# EasyEDA Pro project entrada_erick_v7_2026-11-13.epro

# Schematic Schematic1
Board Name: Board1; Create Date: 2026-11-04; Page Name: P1; Project Name: RUSH - corrigido; Schematic Name: Schematic1; Update Date: 2026-11-06; Company: EasyEDA.com; Drawn: Erick; Page Size: A4; Version: V1.0
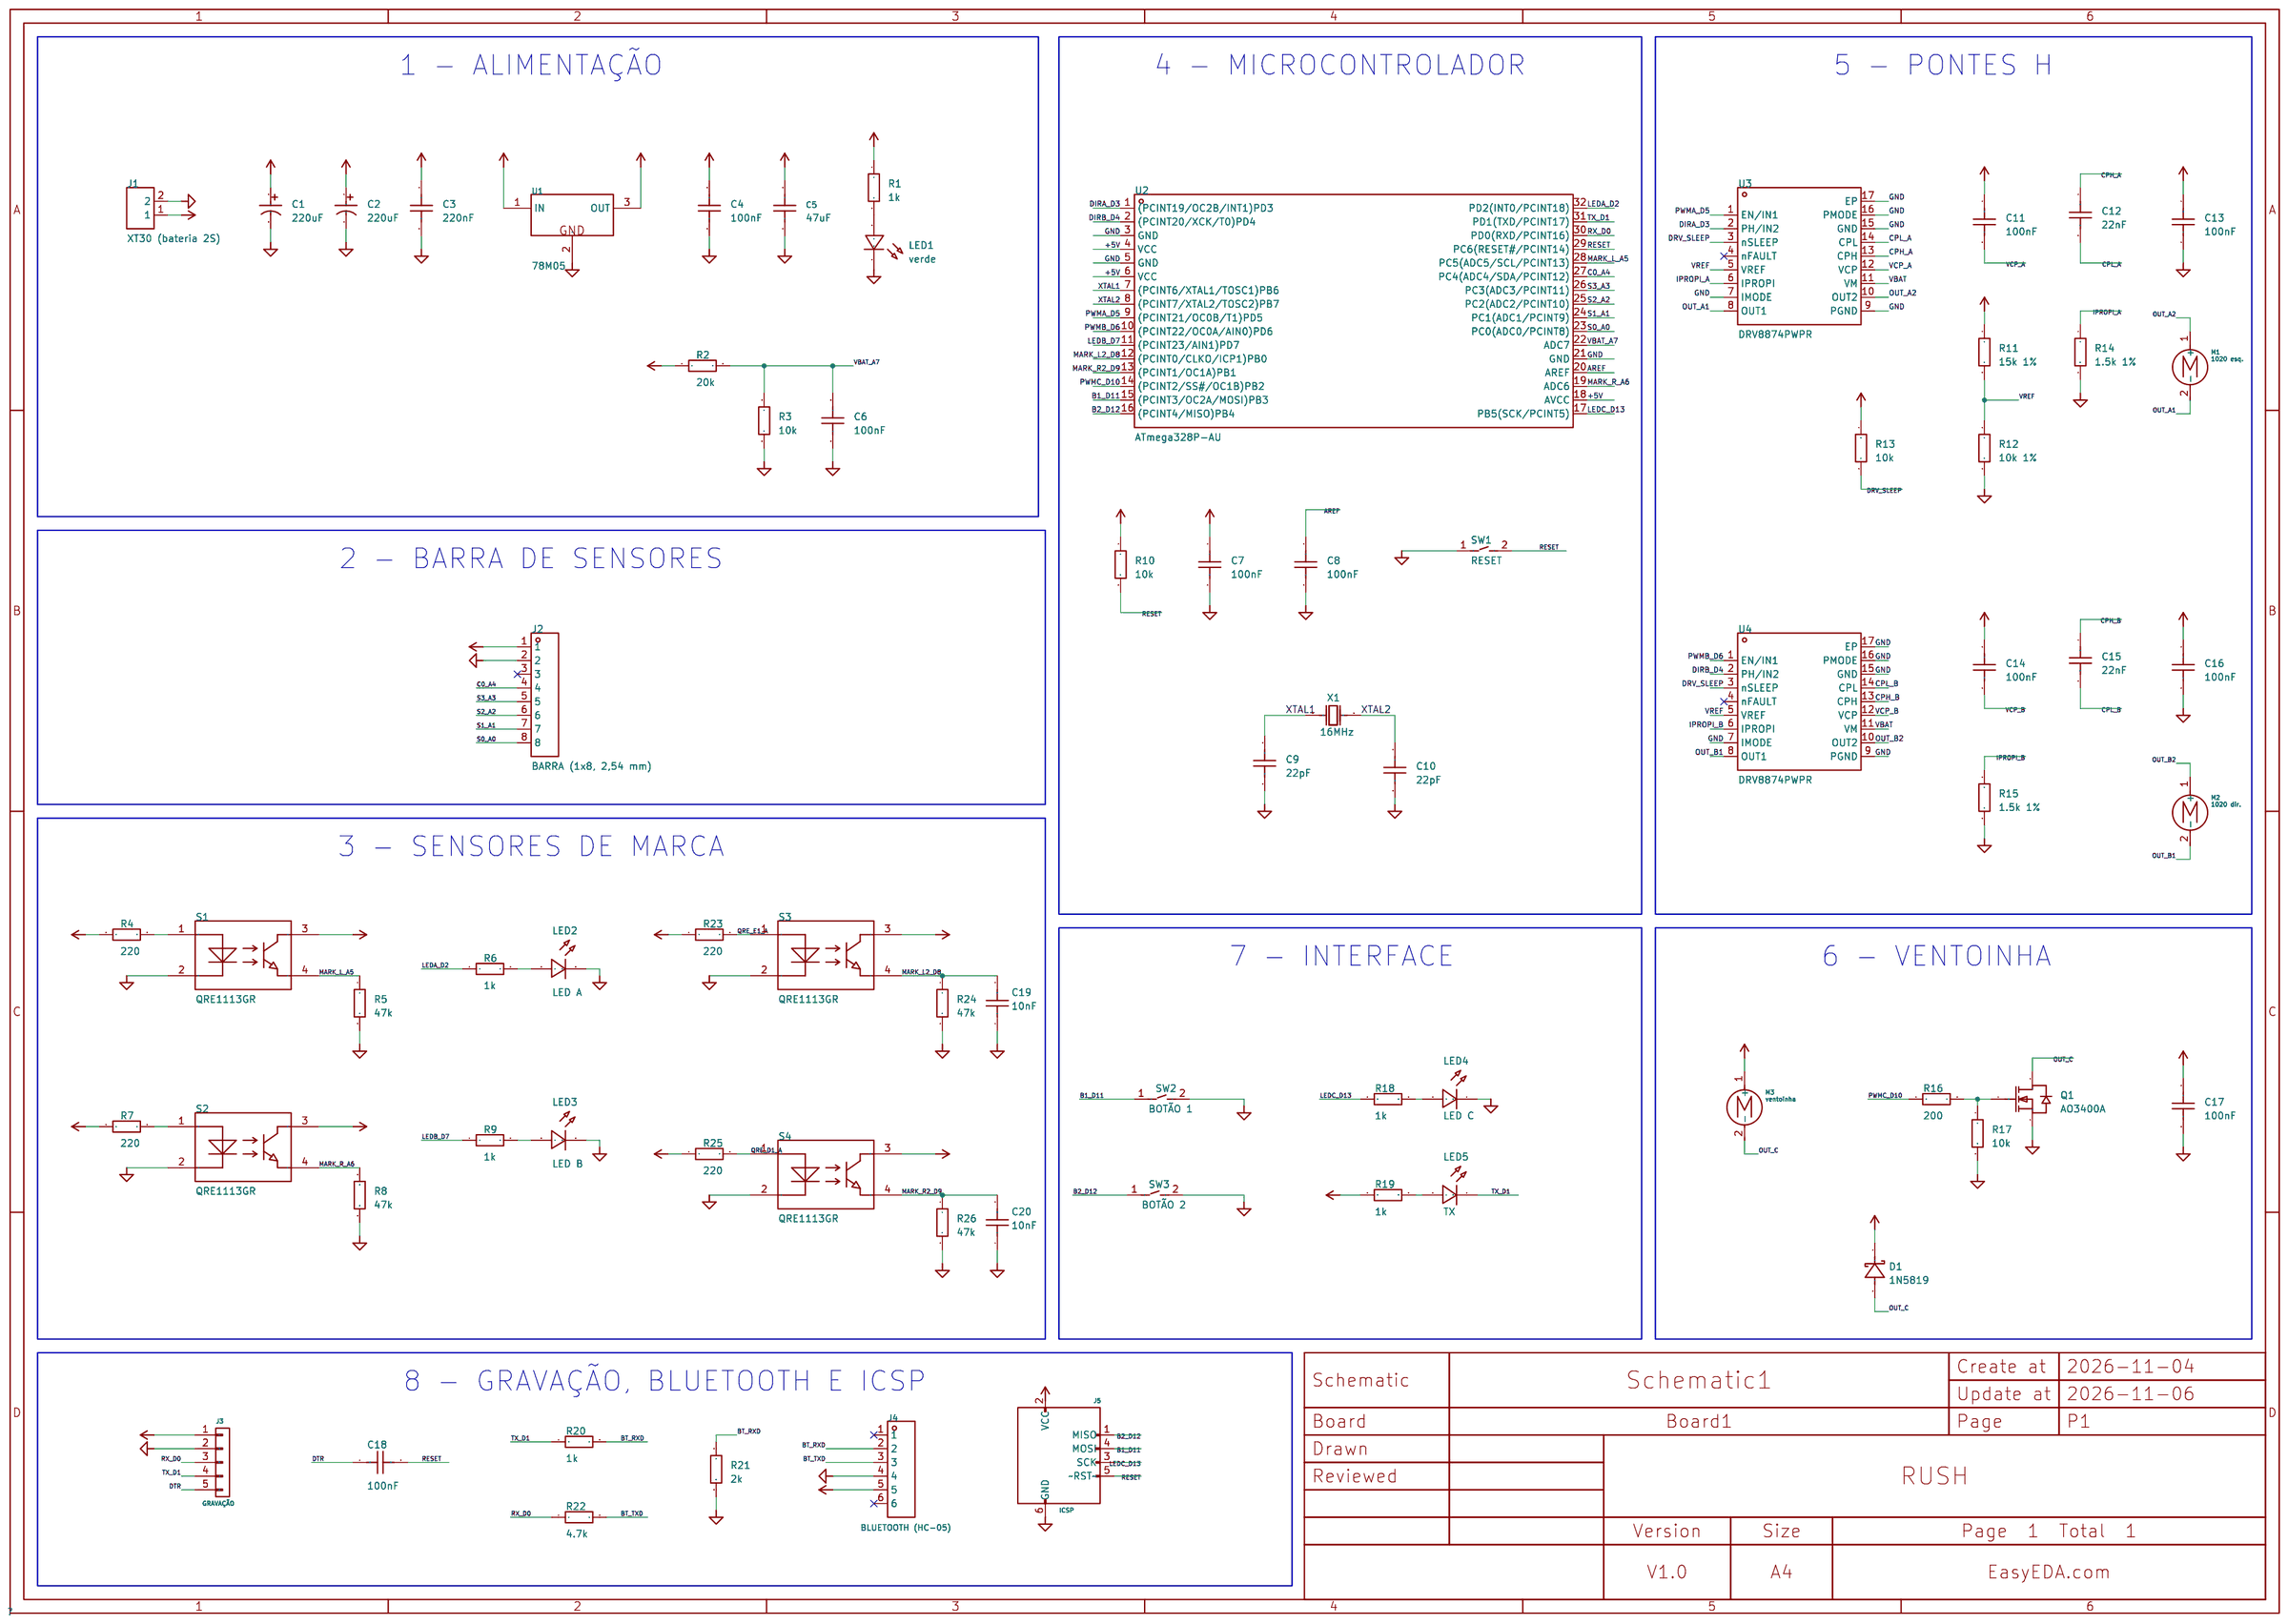
[diagram p0: schematic sheet]

## Parts
C1  220uF  [CAP-TH_BD6.3-P2.50-D1.0-FD]
C2  220uF  [CAP-TH_BD6.3-P2.50-D1.0-FD]
C3  220nF  [C0603]
C4  100nF  [C0603]
C5  47uF  [C1210]
C6  100nF  [C0603]
C7  100nF  [C0603]
C8  100nF  [C0603]
C9  22pF  [C0603]
C10  22pF  [C0603]
C11  100nF  [C0603]
C12  22nF  [C0603]
C13  100nF  [C0603]
C14  100nF  [C0603]
C15  22nF  [C0603]
C16  100nF  [C0603]
C17  100nF  [C0603]
C18  100nF  [C0603]
C19  10nF  [C0603]
C20  10nF  [C0603]
D1  1N5819  [SOD-123_L2.7-W1.6-LS3.7-RD-1]
J1  XT30 (bateria 2S)  [CONN-TH_XT30U-M]
J2  BARRA (1x8, 2,54 mm)  [HDR-TH_8P-P2.54-V-M]
J3  GRAVAÇÃO  [seguidor_alpha:HDR_1x05_P2.54_SMD_DEITADA]
J4  BLUETOOTH (femea 1x6, ordem HC-05)  [HDR-TH_6P-P2.54-V-F]
J5  ICSP  [seguidor_alpha:ICSP_6P_SMD_BOT]
LED1  verde  [LED0603-RD_GREEN]
LED2  LED A  [LED0603-RD_GREEN]
LED3  LED B  [LED0603-RD_GREEN]
LED4  LED C  [LED0603-RD_GREEN]
LED5  TX  [LED0603-RD_GREEN]
M1  1020 esq.  [seguidor_alpha:MOTOR_1020_2P]
M2  1020 dir.  [seguidor_alpha:MOTOR_1020_2P]
M3  ventoinha  [seguidor_alpha:MOTOR_1020_2P]
Q1  AO3400A  [SOT-23-3_L2.9-W1.3-P1.90-LS2.4-BR]
R1  1k  [R0603]
R2  20k 1%  [R0603]
R3  10k 1%  [R0603]
R4  220  [R0603]
R5  47k  [R0603]
R6  1k  [R0603]
R7  220  [R0603]
R8  47k  [R0603]
R9  1k  [R0603]
R10  10k  [R0603]
R11  15k 1%  [R0603]
R12  10k 1%  [R0603]
R13  10k  [R0603]
R14  1.5k 1%  [R0603]
R15  1.5k 1%  [R0603]
R16  200  [R0603]
R17  10k  [R0603]
R18  1k  [R0603]
R19  1k  [R0603]
R20  1k  [R0603]
R21  2k  [R0603]
R22  4.7k  [R0603]
R23  220  [R0603]
R24  47k  [R0603]
R25  220  [R0603]
R26  47k  [R0603]
S1  QRE1113GR  [OPTO-SMD_QRE1113GR]
S2  QRE1113GR  [OPTO-SMD_QRE1113GR]
S3  QRE1113GR  [OPTO-SMD_QRE1113GR]
S4  QRE1113GR  [OPTO-SMD_QRE1113GR]
SW1  RESET  [KEY-SMD_L6.1-W3.7-LS8.0-2]
SW2  BOTÃO 1  [KEY-SMD_L6.1-W3.7-LS8.0-2]
SW3  BOTÃO 2  [KEY-SMD_L6.1-W3.7-LS8.0-2]
U1  78M05  [TO-252-2_L6.5-W6.1-P4.58-LS10.0-TL]
U2  ATmega328P-AU  [TQFP-32_L7.0-W7.0-P0.80-LS9.0-BL]
U3  DRV8874PWPR  [HTSSOP-16_L5.0-W4.4-P0.65-LS6.4-BL-EP]
U4  DRV8874PWPR  [HTSSOP-16_L5.0-W4.4-P0.65-LS6.4-BL-EP]
X1  16MHz  [CRYSTAL-SMD_L5.0-W3.2]

## Library data of the parts
C1 C2 = KM221M025E110A: entre os pes da carcaca, como no EVA-RT; LCSC Part Name: 220uF ±20% 25V; Supplier Part: C59416; Manufacturer: CapXon(丰宾); Supplier Footprint: 插件,D6.3xL11mm; JLCPCB Part Class: Extended Part; Datasheet: https://item.szlcsc.com/datasheet/KM221M025E110A/60469.html; Supplier: LCSC; Tolerance: ±20%; Voltage Rating: 25V; Ripple Current: 235mA@120Hz; Pin Spacing: 2.5mm; Diameter: 6.3mm; Height - Seated (Max): 11mm; Lifetime: 2000hrs@105℃; Operating Temperature: -40℃~+105℃; Polarity type: Polarized; Encapsulamento: eletrolitico 25 V, radial D6,3 mm P2,5; DNP: no
C3 = CAP_0603: Supplier Footprint: 0603; Encapsulamento: 0603 50 V; DNP: no; Voltage Rating: 50V
C4 C9 C10 = CAP_0603: Supplier Footprint: 0603; Encapsulamento: 0603; DNP: no; Voltage Rating: 16V
C5 = GRM32ER61A476KE20L: Capacitance:47uF Tolerance:±10% Tolerance:±10% Voltage Rating:10V Temperature Coefficient:X5R; LCSC Part Name: 47uF ±10% 10V; Supplier Part: C397312; Manufacturer: muRata(村田); Supplier Footprint: 1210; JLCPCB Part Class: Extended Part; Datasheet: https://item.szlcsc.com/datasheet/GRM32ER61A476KE20L/378872.html; Supplier: LCSC; Tolerance: ±10%; Voltage Rating: 10V; Temperature Coefficient: X5R
C6 = CAP_0603: filtro da medicao (opcional); Supplier Footprint: 0603; Encapsulamento: 0603; DNP: no; Voltage Rating: 16V
C7 = CAP_0603: junto aos pinos VCC; Supplier Footprint: 0603; Encapsulamento: 0603; DNP: no; Voltage Rating: 16V
C8 = CAP_0603: AREF (referencia = AVCC no firmware); Supplier Footprint: 0603; Encapsulamento: 0603; DNP: no; Voltage Rating: 16V
C11 C14 = CAP_0603: VCP -> VM; Supplier Footprint: 0603; Encapsulamento: 0603 16 V X7R; DNP: no; Voltage Rating: 16V
C12 C15 = CAP_0603: CPH -> CPL (tensao >= VM); Supplier Footprint: 0603; Encapsulamento: 0603 50 V X7R; DNP: no; Voltage Rating: 50V
C13 C16 = CAP_0603: VM, junto ao pino 11; Supplier Footprint: 0603; Encapsulamento: 0603 25 V X7R; DNP: no; Voltage Rating: 25V
C17 = CAP_0603: Supplier Footprint: 0603; Encapsulamento: 0603 25 V; DNP: no; Voltage Rating: 25V
C18 = CAP_0603: reset automatico pelo DTR; Supplier Footprint: 0603; Encapsulamento: 0603; DNP: no; Voltage Rating: 16V
C19 = CAP_0603: filtro RC com o 47k (trilha longa ate o pino 12); ver PINOS.md; Supplier Footprint: 0603; Encapsulamento: 0603; DNP: no; Voltage Rating: 50V
C20 = CAP_0603: DNP: montar so para leitura por tempo de descarga (ver PINOS.md); Supplier Footprint: 0603; Encapsulamento: 0603; DNP: yes; Voltage Rating: 50V
D1 = 1N5819HW: diodo de roda livre (novo; o EVA-RT nao tem); LCSC Part Name: 电压:40V 电流:1A; Supplier Part: C2905649; Manufacturer: TECH PUBLIC(台舟); Supplier Footprint: SOD-123; JLCPCB Part Class: Extended Part; Datasheet: https://item.szlcsc.com/datasheet/1N5819HW/3175946.html; Supplier: LCSC; Voltage - Forward(Vf@If): 900mV@3A; Voltage - DC Reverse(Vr): 40V; Current - Rectified: 1A; Reverse Leakage Current (Ir): 1mA@40V; Non-Repetitive Peak Forward Surge Current: 9A; Encapsulamento: SOD-123 (B5819W) ou 1N5819 nos terminais do motor; DNP: no
J1 = XT30U-M.G.B: pino 1 = +, pino 2 = -; LCSC Part Name: AMASS(艾迈斯)模插头锂电池插头电机控制器充电器电池接头连接器焊接 2芯锂电插头 黑色 公头15AXT30U-M.G.B; Supplier Part: C19268020; Manufacturer: AMASS(艾迈斯); JLCPCB Part Class: Extended Part; Datasheet: https://item.szlcsc.com/datasheet/XT30U-M.G.B/20526031.html; Supplier: LCSC; Encapsulamento: XT30PW-M de placa ou rabicho XT30; DNP: no
J2 = 2.54-1*8: Pin Structure:1x8P Pitch:2.54mm Circluar Pins/Square Pins:Pin Header Mounting Type:Through Hole Number of Rows:1 Number of Pins:8P Current Rating:2.5A Length of Mating Pin:6mm Insulation Height:2.54mm Length of End Connection Pin:3mm Contact Material:Bras; LCSC Part Name: 1x8P 间距:2.54mm 方针 直插; Supplier Part: C5156616; Manufacturer: ZHOURI(洲日); Supplier Footprint: 插件,P=2.54mm; JLCPCB Part Class: Extended Part; Datasheet: https://item.szlcsc.com/datasheet/2.54-1*8/5790716.html; Supplier: LCSC; Pin Structure: 1x8P; Pitch: 2.54mm; Circluar Pins/Square Pins: Pin Header; Mounting Type: Through Hole; Number of Rows: 1; Number of Pins: 8P; Current Rating: 2.5A; Length of Mating Pin: 6mm; Insulation Height: 2.54mm; Length of End Connection Pin: 3mm; Contact Material: Brass; Contact Plating: Gold; Operating Temperature: -40℃~+105℃; Encapsulamento: barra de pinos 1x8 2,54 mm; DNP: no
J3 = Connector_Generic_Conn_01x05: 1=+5V, 2=GND, 3=RX_D0, 4=TX_D1, 5=DTR. Face inferior no layout.; Encapsulamento: 5 pads SMD, passo 2,54 mm; montagem na face inferior; DNP: no
J4 = 2.54-1*6P母: frente direita, x = 32,5; HC-06 nas vias 2-5 (virado); LCSC Part Name: 1x6P 间距:2.54mm 直插; Supplier Part: C40877; Manufacturer: BOOMELE(博穆精密); Supplier Footprint: 插件,P=2.54mm; JLCPCB Part Class: Extended Part; Datasheet: https://item.szlcsc.com/datasheet/2.54-1*6P%25E6%25AF%258D/41861.html; Supplier: LCSC; Holes Structure: 1x6P; Pitch: 2.54mm; Circular Hole / Square Hole: Square Hole; Mounting Type: Through Hole; Number of Rows: 1; Number of Positions: 6P; Current Rating: 3A; Holes Direction: Top; Insulation Height: 8.5mm; Contact Material: Brass; Contact Plating: Gold; Operating Temperature: -40℃~+105℃; PIN Length: 3.2mm; Encapsulamento: barra femea 1x6 2,54 mm; DNP: no
J5 = Connector_AVR-ISP-6: posicoes do EVA-RT: x 33,97/36,51; y -8,36/-10,90/-13,44; Encapsulamento: 6 pads SMD D1,8 em grade 2,54; DNP: no
LED1 = LED_0603-G: indica 5 V presente; Encapsulamento: 0603; DNP: no
LED2 LED3 LED5 = LED_0603-G: Encapsulamento: 0603; DNP: no
LED4 = LED_0603-G: vermelho; o LED3 em paralelo do EVA-RT foi retirado; Encapsulamento: 0603; DNP: no
M1 M2 = Motor_Motor_DC: coreless 1020 7,4 V; se girar ao contrario, inverta os fios; Encapsulamento: 2 pads; DNP: no
M3 = Motor_Motor_DC: coreless 1020 7,4 V; Encapsulamento: 2 pads; DNP: no
Q1 = AO3400A_C20917: no lugar do IRFR3411/RM10N100LD; liga totalmente com 5 V no gate; LCSC Part Name: N沟道 耐压:30V; Supplier Part: C20917; Manufacturer: AOS; Supplier Footprint: SOT-23; JLCPCB Part Class: Basic Part; Datasheet: https://item.szlcsc.com/datasheet/AO3400A/21629.html; Supplier: LCSC; Number: 1 N-channel; Drain to Source Voltage: 30V; Current - Continuous Drain(Id): 5.7A; RDS(on): 48mΩ@2.5V; Pd - Power Dissipation: 1.4W; Gate Threshold Voltage (Vgs(th)): 1.45V; Gate Charge(Qg): 7nC@10V; Input Capacitance(Ciss): 630pF; Reverse Transfer Capacitance (Crss@Vds): 50pF; Operating Temperature: -55℃~+150℃; Type: N-Channel; Output Capacitance(Coss): 75pF; Vgs: ±12V; Encapsulamento: SOT-23 (1 = G, 2 = S, 3 = D); DNP: no
R1 R4-R9 R18 R19 R23-R26 = Res_0603: Supplier Footprint: 0603; Encapsulamento: 0603; DNP: no
R2 R3 = Res_0603: medicao da bateria (opcional); Supplier Footprint: 0603; Encapsulamento: 0603; DNP: no
R10 = Res_0603: EVA-RT usava 1k; 10k com reset automatico por DTR; Supplier Footprint: 0603; Encapsulamento: 0603; DNP: no
R11 R12 = Res_0603: VREF = 2,0 V; Supplier Footprint: 0603; Encapsulamento: 0603; DNP: no
R13 = Res_0603: nSLEEP sempre alto (pull-down interno de 100k); Supplier Footprint: 0603; Encapsulamento: 0603; DNP: no
R14 R15 = Res_0603: IPROPI -> limite de corrente; Supplier Footprint: 0603; Encapsulamento: 0603; DNP: no
R16 = Res_0603: gate; Supplier Footprint: 0603; Encapsulamento: 0603; DNP: no
R17 = Res_0603: gate -> GND (desligado no boot); Supplier Footprint: 0603; Encapsulamento: 0603; DNP: no
R20 R21 = Res_0603: divisor 5 V -> 3,3 V; Supplier Footprint: 0603; Encapsulamento: 0603; DNP: no
R22 = Res_0603: 4,7k: grava com o HC-05 encaixado (sem LED de RX); Supplier Footprint: 0603; Encapsulamento: 0603; DNP: no
S1-S4 = QRE1113GR: datasheet: 1 = anodo, 2 = catodo, 3 = coletor, 4 = emissor; LCSC Part Name: 微型反射式物体传感器; Supplier Part: C232862; Manufacturer: onsemi(安森美); Supplier Footprint: SMD-4P; JLCPCB Part Class: Extended Part; Datasheet: https://item.szlcsc.com/datasheet/QRE1113GR/232660.html; Supplier: LCSC; Sensing Distance: 1mm; Voltage - Forward(Vf): 1.2V; C-E Saturation Voltage: 30V; Current - Collector(Ic): 20mA; Reverse Pressure (Typ): 5V; Forward Current(If): 50mA; Wavelength: 940nm; Output Type: Phototransistor; Vce Saturation(VCE(sat)): 0.3V@If=20mA,Ic=50uA; Rise time: 20us@Vcc=5V,Ic=100uA,Rl=1kΩ; Fall time: 20us@Vcc=5V,Ic=100uA,Rl=1kΩ; Power Dissipation(Pd): 50mW; Operating Temperature: -40℃~+85℃; Encapsulamento: SMD 4 pinos; DNP: no
SW1-SW3 = TVBM17-025CF-R: Circuit:SPST Actuator Style:Rectangular Button Mounting Type:Surface Mount,Vertical Length:6.1mm Width:3.7mm Switch Height:2.5mm with Bracket:Without Bracket Contact Current:50mA Voltage Rating:12V With Lamp:No Termination Style:Gull Wing Operating Temper; LCSC Part Name: 一型/贴片/2.5H/250gf/黑底PPA白钮/防尘/编带; Supplier Part: C19271064; Manufacturer: jianfu(键富); Supplier Footprint: SMD,6.1x3.7mm; JLCPCB Part Class: Extended Part; Datasheet: https://item.szlcsc.com/datasheet/TVBM17-025CF-R/20539419.html; Supplier: LCSC; Circuit: SPST; Actuator Style: Rectangular Button; Mounting Type: Surface Mount,Vertical; Length: 6.1mm; Width: 3.7mm; Switch Height: 2.5mm; with Bracket: Without Bracket; Contact Current: 50mA; Voltage Rating: 12V; With Lamp: No; Termination Style: Gull Wing; Operating Temperature: -40℃~+85℃
U1 = 78M05_C111265: Output Configuration:Positive Voltage - Supply:35V Output Voltage:5V Output Voltage:5V Output Current:500mA Power Supply Rejection Ratio (PSRR):78dB@(120Hz) Voltage Dropout:2V@(500mA) standby current:6mA Noise:- Features:- Operating Temperature:-40℃~+125℃; LCSC Part Name: 5V 500mA 35V; Supplier Part: C111265; Manufacturer: SHIKUES(时科); Supplier Footprint: TO-252-2(DPAK); JLCPCB Part Class: Extended Part; Datasheet: https://item.szlcsc.com/datasheet/78M05/112491.html; Supplier: LCSC; Output Configuration: Positive; Voltage - Supply: 35V; Output Voltage: 5V; Output Current: 500mA; Power Supply Rejection Ratio (PSRR): 78dB@(120Hz); Voltage Dropout: 2V@(500mA); standby current: 6mA; Operating Temperature: -40℃~+125℃; Output Type: Fixed; Number of Outputs: 1; Encapsulamento: TO-252 (DPAK); DNP: no
U2 = ATMEGA328P-AU_C14877: do Nano/Uno doador (com bootloader) ou novo + bootloader pelo ICSP; LCSC Part Name: 基于AVR增强型RISC架构的低功耗CMOS 8位微控制器; Supplier Part: C14877; Manufacturer: MICROCHIP(美国微芯); Manufacturer Part: ATMEGA328P-AU; Supplier Footprint: TQFP-32(7x7); JLCPCB Part Class: Extended Part; Datasheet: https://item.szlcsc.com/datasheet/ATMEGA328P-AU/15549.html; Supplier: LCSC; CPU Core: AVR; CPU Maximum Speed: 20MHz; Core Size: 8 Bit; Program Storage Size: 32KB; Program Memory Type: FLASH; RAM Size: 2KB; EEPROM: 1KB; Number of I/O: 23; ADC (Bit): 10bit; Oscillator Type: Built-in; Voltage - Supply: 1.8V~5.5V; Operating Temperature: -40℃~+85℃; Features: External pin reset (NRST)；Built-in general-purpose timer；Power-on reset (POR)；Touch function；Undervoltage detection (BOR/LVD/LVR/LVI)；Programmable watchdog; Encapsulamento: TQFP-32; DNP: no
U3 = DRV8874PWPR: esq.; LCSC Part Name: 6A 有刷直流电机驱动芯片 4.5V~37V; Supplier Part: C1855818; Manufacturer: TI(德州仪器); Supplier Footprint: HTSSOP-16-EP; JLCPCB Part Class: Extended Part; Datasheet: https://www.ti.com/cn/lit/ds/symlink/drv8874.pdf; Supplier: LCSC; Technology: Yes; Number of H-bridges: 1; Peak Current: 6A; RDS(on): 200mΩ; Quiescent Current(Iq): 750nA; Operating Temperature: -40℃~+125℃; Features: Interleaved conduction protection；Current sensing/regulation function; Encapsulamento: HTSSOP-16 (PWP), pad termico com vias; DNP: no
U4 = DRV8874PWPR: dir.; LCSC Part Name: 6A 有刷直流电机驱动芯片 4.5V~37V; Supplier Part: C1855818; Manufacturer: TI(德州仪器); Supplier Footprint: HTSSOP-16-EP; JLCPCB Part Class: Extended Part; Datasheet: https://www.ti.com/cn/lit/ds/symlink/drv8874.pdf; Supplier: LCSC; Technology: Yes; Number of H-bridges: 1; Peak Current: 6A; RDS(on): 200mΩ; Quiescent Current(Iq): 750nA; Operating Temperature: -40℃~+125℃; Features: Interleaved conduction protection；Current sensing/regulation function; Encapsulamento: HTSSOP-16 (PWP), pad termico com vias; DNP: no
X1 = 7A-16.000MAAJ-T: Frequency:16MHz Normal temperature Frequency Tolerance:±30ppm Normal temperature Frequency Tolerance:±30ppm Load Capacitor: Frequency Stability(Full temperature range):±30ppm Frequency Stability(Full temperature range):±30ppm Equivalent Series Resistance; LCSC Part Name: 16MHz ±30ppm 18pF; Supplier Part: C2450102; Manufacturer: TXC(晶技); Supplier Footprint: SMD5032; JLCPCB Part Class: Extended Part; Datasheet: https://atta.szlcsc.com/upload/public/pdf/source/20180326/C97724_C4EFF7A16D0E132C961AD7AA14FCEEAA.pdf; Supplier: LCSC; Normal temperature Frequency Tolerance: ±30ppm; Frequency Stability(Full temperature range): ±30ppm; Equivalent Series Resistance (ESR): 50Ω

## Nets
+5V: C4.1 C5.2 C7.1 J2.1 J3.1(Pin) J4.5 J5.2(VCC) R1.1 R4.1 R7.1 R10.1 R11.1 R13.1 R19.1 R23.1 R25.1 S1.3(C) S2.3(C) S3.3(C) S4.3(C) U1.3(OUT) U2.4(VCC) U2.6(VCC) U2.18(AVCC)
GND: C1.2 C2.2 C3.2 C4.2 C5.1 C6.2 C7.2 C8.2 C9.2 C10.2 C13.2 C16.2 C17.2 C19.1 C20.1 J1.2 J2.2 J3.2(Pin) J4.4 J5.6(GND) LED1.1(C) LED2.1(C) LED3.1(C) LED4.1(C) Q1.2(S) R3.2 R5.2 R8.2 R12.2 R14.2 R15.2 R17.2 R21.2 R24.2 R26.2 S1.2 S2.2 S3.2 S4.2 SW1.1 SW2.2 SW3.2 U1.2(GND) U2.3(GND) U2.5(GND) U2.21(GND) U3.7(IMODE) U3.9(PGND) U3.15(GND) U3.16(PMODE) U3.17(EP) U4.7(IMODE) U4.9(PGND) U4.15(GND) U4.16(PMODE) U4.17(EP)
VBAT: C1.1 C2.1 C3.1 C11.1 C13.1 C14.1 C16.1 C17.1 D1.1(K) J1.1 M3.1(+) R2.1 U1.1(IN) U3.11(VM) U4.11(VM)
VBAT_A7: C6.1 R2.2 R3.1 U2.22(ADC7)
AREF: C8.1 U2.20(AREF)
B1_D11: J5.4(MOSI) SW2.1 U2.15((PCINT3/OC2A/MOSI)PB3)
B2_D12: J5.1(MISO) SW3.1 U2.16((PCINT4/MISO)PB4)
BT_RXD: J4.2 R20.2 R21.1
BT_TXD: J4.3 R22.2
C0_A4: J2.4 U2.27(PC4(ADC4/SDA/PCINT12))
CPH_A: C12.1 U3.13(CPH)
CPH_B: C15.1 U4.13(CPH)
CPL_A: C12.2 U3.14(CPL)
CPL_B: C15.2 U4.14(CPL)
DIRA_D3: U2.1((PCINT19/OC2B/INT1)PD3) U3.2(PH/IN2)
DIRB_D4: U2.2((PCINT20/XCK/T0)PD4) U4.2(PH/IN2)
DRV_SLEEP: R13.2 U3.3(nSLEEP) U4.3(nSLEEP)
DTR: C18.1 J3.5(Pin)
IPROPI_A: R14.1 U3.6(IPROPI)
IPROPI_B: R15.1 U4.6(IPROPI)
LEDA_D2: R6.1 U2.32(PD2(INT0/PCINT18))
LEDB_D7: R9.1 U2.11((PCINT23/AIN1)PD7)
LEDC_D13: J5.3(SCK) R18.1 U2.17(PB5(SCK/PCINT5))
MARK_L2_D8: C19.2 R24.1 S3.4(E) U2.12((PCINT0/CLKO/ICP1)PB0)
MARK_L_A5: R5.1 S1.4(E) U2.28(PC5(ADC5/SCL/PCINT13))
MARK_R2_D9: C20.2 R26.1 S4.4(E) U2.13((PCINT1/OC1A)PB1)
MARK_R_A6: R8.1 S2.4(E) U2.19(ADC6)
OUT_A1: M1.2(-) U3.8(OUT1)
OUT_A2: M1.1(+) U3.10(OUT2)
OUT_B1: M2.2(-) U4.8(OUT1)
OUT_B2: M2.1(+) U4.10(OUT2)
OUT_C: D1.2(A) M3.2(-) Q1.3(D)
PWMA_D5: U2.9((PCINT21/OC0B/T1)PD5) U3.1(EN/IN1)
PWMB_D6: U2.10((PCINT22/OC0A/AIN0)PD6) U4.1(EN/IN1)
PWMC_D10: R16.1 U2.14((PCINT2/SS#/OC1B)PB2)
QRE_D1_A: R25.2 S4.1
QRE_E1_A: R23.2 S3.1
RESET: C18.2 J5.5(~RST~) R10.2 SW1.2 U2.29(PC6(RESET#/PCINT14))
RX_D0: J3.3(Pin) R22.1 U2.30(PD0(RXD/PCINT16))
S0_A0: J2.8 U2.23(PC0(ADC0/PCINT8))
S1_A1: J2.7 U2.24(PC1(ADC1/PCINT9))
S2_A2: J2.6 U2.25(PC2(ADC2/PCINT10))
S3_A3: J2.5 U2.26(PC3(ADC3/PCINT11))
TX_D1: J3.4(Pin) LED5.1(C) R20.1 U2.31(PD1(TXD/PCINT17))
VCP_A: C11.2 U3.12(VCP)
VCP_B: C14.2 U4.12(VCP)
VREF: R11.2 R12.1 U3.5(VREF) U4.5(VREF)
XTAL1: C9.1 U2.7((PCINT6/XTAL1/TOSC1)PB6) X1.1(OSC1)
XTAL2: C10.1 U2.8((PCINT7/XTAL2/TOSC2)PB7) X1.2(OSC2)
$1N2281: R4.2 S1.1
$1N2302: R7.2 S2.1
$1N2303: LED1.2(A) R1.2
$1N2306: LED2.2(A) R6.2
$1N2315: LED3.2(A) R9.2
$1N2362: LED4.2(A) R18.2
$1N2363: LED5.2(A) R19.2
$1N2452: Q1.1(G) R16.2 R17.1

Not connected (* = marked no-connect by the designer): J2 3*; J4 1* 6*; U3 4(nFAULT)*; U4 4(nFAULT)*

## Notes on the sheet
- 1 - ALIMENTAÇÃO
- 4 - MICROCONTROLADOR
- 5 - PONTES H
- 2 - BARRA DE SENSORES
- 3 - SENSORES DE MARCA
- 7 - INTERFACE
- 6 - VENTOINHA
- 8 - GRAVAÇÃO, BLUETOOTH E ICSP

# Board PCB1
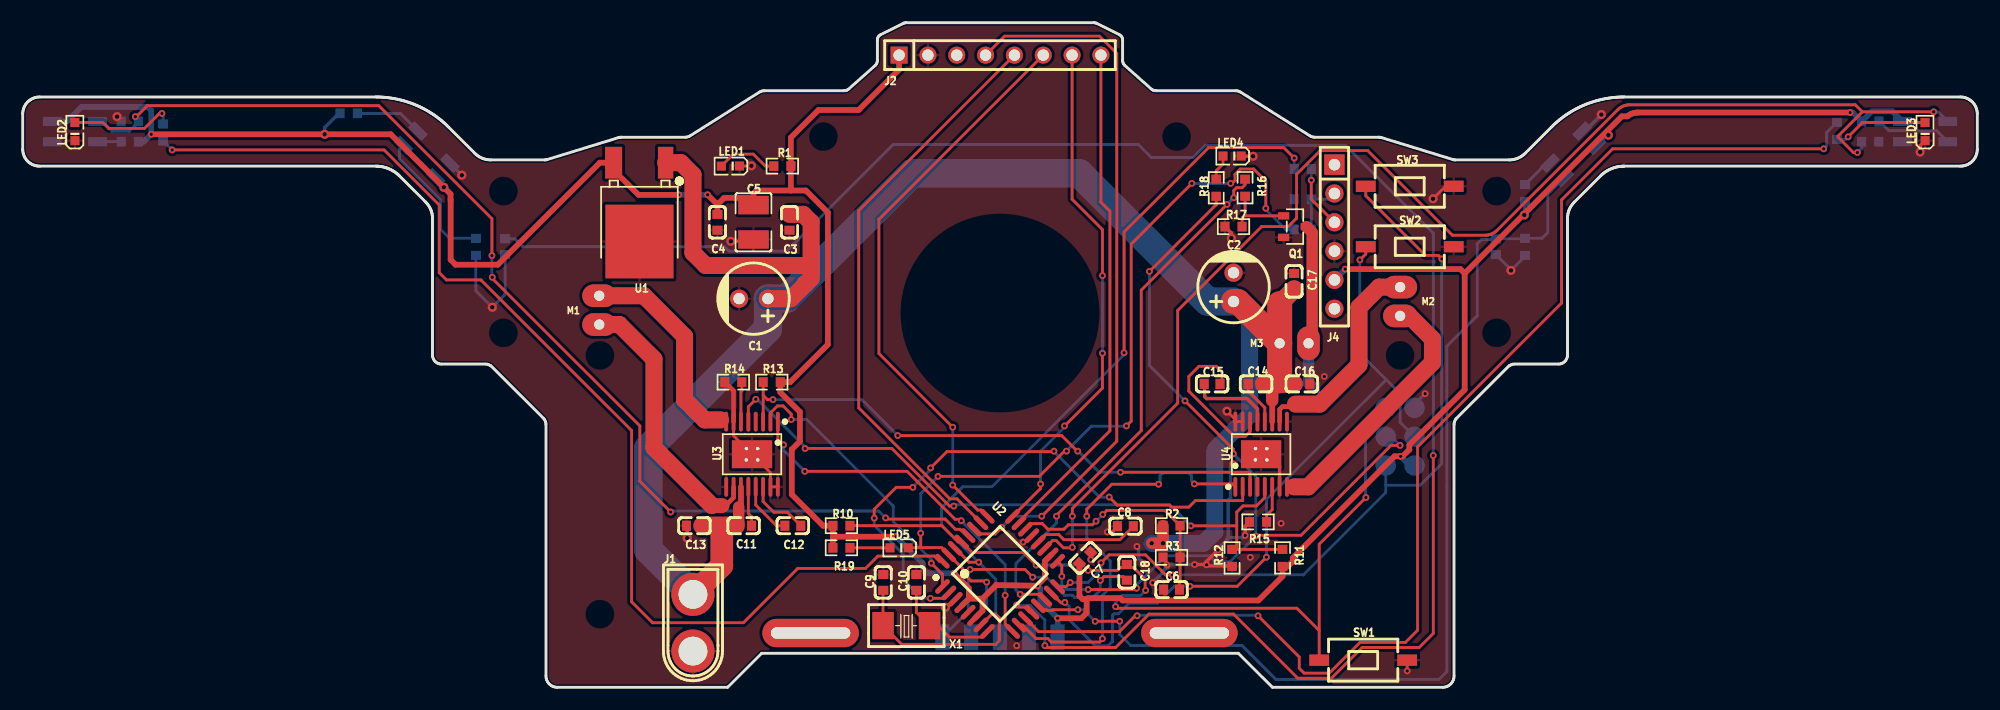
[diagram p1: board, top side]
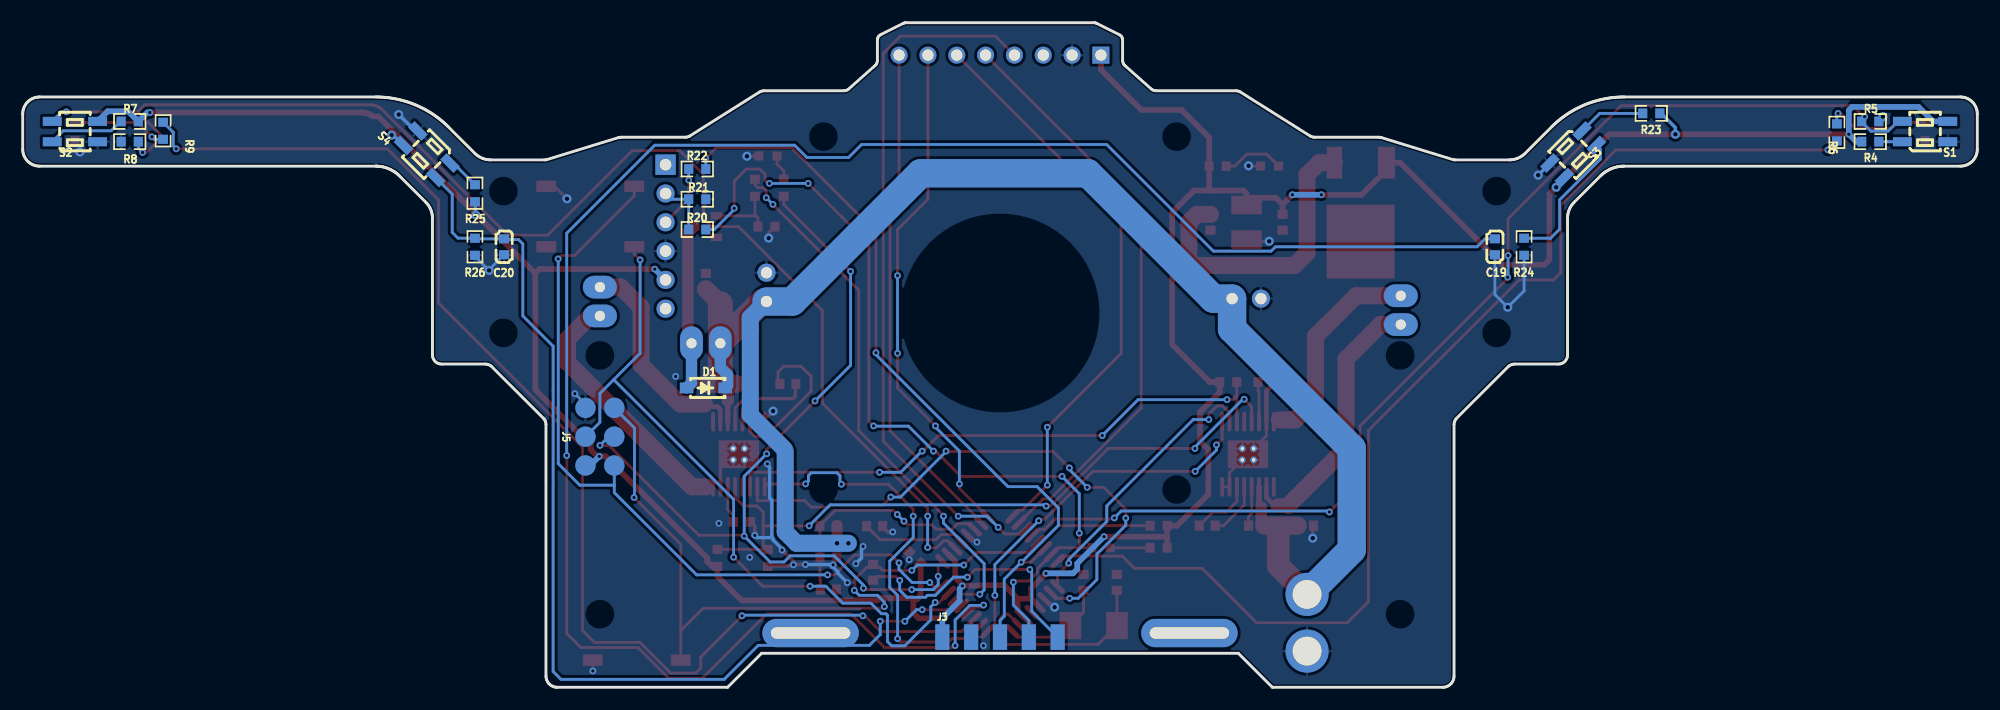
[diagram p2: board, bottom side, seen from below]

Outline 172.2 x 58.6 mm; copper layers: Top Layer, Bottom Layer. Coordinates in mm from the lower left corner of the outline.
Stack: Top Layer 0.035mm / Dielectric1 1.51mm FR4 er 4.5 / Bottom Layer 0.035mm

## Design rules (mm)
spacing copperThickness1oz (default): track to track 0.2, other pairs 0.2 to 0.3
spacing copperThickness2oz: track to track 0.203, other pairs 0.152 to 0.3
spacing Plane_innerPlane: track to track 0.2, other pairs 0.2 to 0.3
spacing Copper_copperRegion: track to track 0.2, other pairs 0.2 to 0.3
track width copperThickness1oz (default): min 0.25, default 0.25, max 3
track width copperThickness2oz: min 0.203, default 0.254, max 2.54
differential pair differentialPair (default): width min 0.127, default 0.254, max 2.54; gap min 0.152, default 0.152
net GND uses Copper_copperRegion, Plane_innerPlane
pour e1780 uses Copper_copperRegion
pour e1924 uses Copper_copperRegion

## Placement (name value [footprint] x y rotation side)
C1  220uF  [CAP-TH_BD6.3-P2.50-D1.0-FD]  64.38 34.27 180 top
C2  220uF  [CAP-TH_BD6.3-P2.50-D1.0-FD]  106.67 35.29 90 top
C3  220nF  [C0603]  67.56 41 270 top
C4  100nF  [C0603]  61.21 41 270 top
C5  47uF  [C1210]  64.38 41 90 top
C6  100nF  [C0603]  101.21 8.62 180 top
C7  100nF  [C0603]  93.59 11.41 45 top
C8  100nF  [C0603]  97.15 14.2 180 top
C9  22pF  [C0603]  75.81 9.25 90 top
C10  22pF  [C0603]  78.73 9.25 90 top
C11  100nF  [C0603]  63.51 14.25 0 top
C12  22nF  [C0603]  67.85 14.25 0 top
C13  100nF  [C0603]  59.18 14.25 180 top
C14  100nF  [C0603]  108.66 26.75 180 top
C15  22nF  [C0603]  104.79 26.75 0 top
C16  100nF  [C0603]  112.69 26.75 0 top
C17  100nF  [C0603]  112.01 35.79 90 top
C18  100nF  [C0603]  97.28 10.14 90 top
C19  10nF  [C0603]  42.5 38.84 90 bottom
C20  10nF  [C0603]  129.79 38.84 90 bottom
D1  1N5819  [SOD-123_L2.7-W1.6-LS3.7-RD-1]  112.01 26.4 0 bottom
J1  XT30 (bateria 2S)  [CONN-TH_XT30U-M]  59.05 5.69 270 top
J2  BARRA (1x8, 2,54 mm)  [HDR-TH_8P-P2.54-V-M]  86.1 55.74 0 top
J3  GRAVAÇÃO  [seguidor_alpha:HDR_1x05_P2.54_SMD_DEITADA]  86.1 4.43 0 bottom
J4  BLUETOOTH (femea 1x6, ordem HC-05)  [HDR-TH_6P-P2.54-V-F]  115.56 39.73 270 top
J5  ICSP  [seguidor_alpha:ICSP_6P_SMD_BOT]  121.35 22.1 0 bottom
LED1  verde  [LED0603-RD_GREEN]  62.35 45.96 180 top
LED2  LED A  [LED0603-RD_GREEN]  4.6 49 90 top
LED3  LED B  [LED0603-RD_GREEN]  167.6 49 90 top
LED4  LED C  [LED0603-RD_GREEN]  106.55 46.84 180 top
LED5  TX  [LED0603-RD_GREEN]  77.21 12.3 180 top
M1  1020 esq.  [seguidor_alpha:MOTOR_1020_2P]  50.79 33.25 0 top
M2  1020 dir.  [seguidor_alpha:MOTOR_1020_2P]  121.35 34.02 180 top
M3  ventoinha  [seguidor_alpha:MOTOR_1020_2P]  112.01 30.33 270 top
NOREF  -  [Pad_e312]  69.41 4.79 270 top
NOREF#2  -  [Pad_e311]  102.78 4.79 270 top
Q1  AO3400A  [SOT-23-3_L2.9-W1.3-P1.90-LS2.4-BR]  112.09 40.62 180 top
R1  1k  [R0603]  66.92 45.95 180 top
R2  20k 1%  [R0603]  101.21 14.25 0 top
R3  10k 1%  [R0603]  101.21 11.46 180 top
R4  220  [R0603]  9.43 48.11 180 bottom
R5  47k  [R0603]  9.43 49.89 180 bottom
R6  1k  [R0603]  12.37 48.93 90 bottom
R7  220  [R0603]  162.77 49.89 0 bottom
R8  47k  [R0603]  162.77 48.11 0 bottom
R9  1k  [R0603]  159.83 49.07 270 bottom
R10  10k  [R0603]  72.13 14.25 0 top
R11  15k 1%  [R0603]  110.99 11.41 90 top
R12  10k 1%  [R0603]  106.55 11.41 270 top
R13  10k  [R0603]  65.99 26.91 180 top
R14  1.5k 1%  [R0603]  62.6 26.91 180 top
R15  1.5k 1%  [R0603]  108.83 14.58 180 top
R16  200  [R0603]  107.69 44.05 270 top
R17  10k  [R0603]  106.67 40.62 180 top
R18  1k  [R0603]  105.15 44.04 90 top
R19  1k  [R0603]  72.13 12.3 0 top
R20  1k  [R0603]  112.77 40.37 0 bottom
R21  2k  [R0603]  112.77 43.03 180 bottom
R22  4.7k  [R0603]  112.77 45.7 0 bottom
R23  220  [R0603]  28.72 50.6 0 bottom
R24  47k  [R0603]  39.93 38.84 270 bottom
R25  220  [R0603]  132.36 43.56 90 bottom
R26  47k  [R0603]  132.36 38.84 270 bottom
S1  QRE1113GR  [OPTO-SMD_QRE1113GR]  4.6 49 180 bottom
S2  QRE1113GR  [OPTO-SMD_QRE1113GR]  167.6 49 180 bottom
S3  QRE1113GR  [OPTO-SMD_QRE1113GR]  35.6 47 315 bottom
S4  QRE1113GR  [OPTO-SMD_QRE1113GR]  136.6 47 45 bottom
SW1  RESET  [KEY-SMD_L6.1-W3.7-LS8.0-2]  118.1 2.39 180 top
SW2  BOTÃO 1  [KEY-SMD_L6.1-W3.7-LS8.0-2]  122.2 38.84 0 top
SW3  BOTÃO 2  [KEY-SMD_L6.1-W3.7-LS8.0-2]  122.2 44.18 0 top
U1  78M05  [TO-252-2_L6.5-W6.1-P4.58-LS10.0-TL]  54.35 42.78 270 top
U2  ATmega328P-AU  [TQFP-32_L7.0-W7.0-P0.80-LS9.0-BL]  86.1 10 315 top
U3  DRV8874PWPR  [HTSSOP-16_L5.0-W4.4-P0.65-LS6.4-BL-EP]  64.25 20.55 180 top
U4  DRV8874PWPR  [HTSSOP-16_L5.0-W4.4-P0.65-LS6.4-BL-EP]  109.11 20.55 0 top
X1  16MHz  [CRYSTAL-SMD_L5.0-W3.2]  77.84 5.44 0 top

## Footprints (pads in the part's own frame, mm; a bottom-side part is the same pattern mirrored in y, then rotated)
C0603
  rect 0.8x0.9 smd: 1(-0.7,0) 2(0.7,0)
C1210
  rect 1.635x2.7 smd: 1(-1.518,0) 2(1.518,0)
CAP-TH_BD6.3-P2.50-D1.0-FD
  round 1.6 hole 1: 1(-1.27,0) 2(1.27,0)
CONN-TH_XT30U-M
  round 3.8 hole 2.54: 1(-2.5,0) 2(2.5,0)
CRYSTAL-SMD_L5.0-W3.2
  rect 1.9x2.4 smd: 1(-2.05,0) 2(2.05,0)
HDR-TH_6P-P2.54-V-F
  rect 1.8x1.8 hole 1.02: 1(-6.35,0)
  round 1.6 hole 1.02: 2(-3.81,0) 3(-1.27,0) 4(1.27,0) 5(3.81,0) 6(6.35,0)
HDR-TH_8P-P2.54-V-M
  rect 1.5x1.5 hole 1: 1(-8.89,0)
  round 1.5 hole 1: 2(-6.35,0) 3(-3.81,0) 4(-1.27,0) 5(1.27,0) 6(3.81,0) 7(6.35,0) 8(8.89,0)
HTSSOP-16_L5.0-W4.4-P0.65-LS6.4-BL-EP
  oval 0.343x1.746 smd: 1(-2.275,-2.873) 2(-1.625,-2.873) 3(-0.975,-2.873) 4(-0.325,-2.873) 5(0.325,-2.873) 6(0.975,-2.873) 7(1.625,-2.873) 8(2.275,-2.873) 9(2.275,2.873) 10(1.625,2.873) 11(0.975,2.873) 12(0.325,2.873) 13(-0.325,2.873) 14(-0.975,2.873) 15(-1.625,2.873) 16(-2.275,2.873)
  round 0.61 hole 0.305: 17(-0.5,0.5) 17(-0.5,-0.5) 17(0.5,0.5) 17(0.5,-0.5)
  rect 3.55x2.46 smd: 17(0,0)
KEY-SMD_L6.1-W3.7-LS8.0-2
  rect 1.75x1 smd: 1(-3.875,0) 2(3.875,0)
LED0603-RD_GREEN
  rect 0.8x0.8 smd: 1(-0.799,-0.004) 2(0.799,0.004)
OPTO-SMD_QRE1113GR
  rect 1.66x0.8 smd: 1(-2,-0.9) 2(2,-0.9) 3(2,0.9) 4(-2,0.9)
Pad_e311
  oval 2.5x8.5 hole 1x7: 1(0,0)
Pad_e312
  oval 2.5x8.5 hole 1x7: 1(0,0)
R0603
  rect 0.806x0.864 smd: 1(-0.753,0) 2(0.753,0)
seguidor_alpha:HDR_1x05_P2.54_SMD_DEITADA
  rect 1.25x2.25 smd: 1(5.08,0) 2(2.54,0) 3(0,0) 4(-2.54,0) 5(-5.08,0)
seguidor_alpha:ICSP_6P_SMD_BOT
  round 1.8 smd: 1(-1.27,2.54) 2(1.27,2.54) 3(-1.27,0) 4(1.27,0) 5(-1.27,-2.54) 6(1.27,-2.54)
seguidor_alpha:MOTOR_1020_2P
  oval 3x2 hole 0.9: 1(0,-1.27) 2(0,1.27)
SOD-123_L2.7-W1.6-LS3.7-RD-1
  rect 1.2x0.95 smd: 1(-1.7,0) 2(1.7,0)
SOT-23-3_L2.9-W1.3-P1.90-LS2.4-BR
  rect 1x0.65 smd: 1(1,-0.95) 2(1,0.95) 3(-1,0)
TO-252-2_L6.5-W6.1-P4.58-LS10.0-TL
  rect 2.8x1.35 smd: 1(-3.475,2.29)
  rect 6.5x6 smd: 2(3.475,-0.017)
  rect 2.8x1.5 smd: 3(-3.475,-2.29)
TQFP-32_L7.0-W7.0-P0.80-LS9.0-BL
  oval 0.45x1.65 smd: 1(-2.8,-4.369) 2(-2,-4.369) 3(-1.2,-4.369) 4(-0.4,-4.369) 5(0.4,-4.369) 6(1.2,-4.369) 7(2,-4.369) 8(2.8,-4.369) 17(2.8,4.369) 18(2,4.369) 19(1.2,4.369) 20(0.4,4.369) 21(-0.4,4.369) 22(-1.2,4.369) 23(-2,4.369) 24(-2.8,4.369)
  oval 1.65x0.45 smd: 9(4.381,-2.8) 10(4.381,-2) 11(4.381,-1.2) 12(4.381,-0.4) 13(4.381,0.4) 14(4.381,1.2) 15(4.381,2) 16(4.381,2.8) 25(-4.381,2.8) 26(-4.381,2) 27(-4.381,1.2) 28(-4.381,0.4) 29(-4.381,-0.4) 30(-4.381,-1.2) 31(-4.381,-2) 32(-4.381,-2.8)

## Nets
As in the schematic.

Pads without a net: J2 3; J4 1 6; NOREF 1; NOREF#2 1; U3 4; U4 4

## Via types
v1: diameter 0.8, hole 0.4, Top Layer to Bottom Layer, 20 vias
v2: diameter 0.6, hole 0.3, Top Layer to Bottom Layer, 123 vias

## Routing (per net, layer and track width the routed paths; a pad name or vN(x,y) marks a point on that pad's centre or on a via; arc(x,y) is an arc through that point)
+5V: length 298.2
  Top Layer w0.5: 84.56,7.82 85.75,9.01 89.34,8.95 89.37,8.98 ; 84.56,7.82 83.35,7.82 ; 84.56,7.82 84.56,6.76 U2.6 ; 71.38,13.28 R10.1 70.51,14.25 67.75,17 67.75,20.97 68.47,21.69 68.47,24.28 66.74,26.01 R13.1 67.61,26.91 70.93,30.23 70.93,41.87 69,43.8 67.68,43.8 ; 71.38,13.28 v2(76.94,13.28) ; 71.38,13.28 R19.1 ; 127.04,36.5 126.67,36.87 v2(116.51,36.87) ; 127.04,36.5 140.88,50.34 141.36,50.34 141.48,50.43 141.61,50.5 141.74,50.57 141.88,50.62 142.02,50.65 142.17,50.67 142.32,50.68 161,50.68 ; 127.04,36.5 127.04,26.24 122.16,21.36 122.16,20.96 121.57,20.37 v2(121.4,20.37) 120.85,20.37 111.89,11.4 111.89,11.11 111.44,10.66 R11.1 110.99,9.79 108.86,7.66 96.9,7.66 96.69,7.86 93.86,7.86 93.76,7.76 93.73,7.76 ; 41.85,37.26 50.84,46.25 U1.3 ; 64.38,43.16 64.38,43.55 64.64,43.8 67.68,43.8 ; 64.38,43.16 64.38,42.52 ; 64.38,43.16 61.8,43.16 61.21,42.57 C4.1 ; v2(57.79,43.43) 57.78,43.41 54.26,43.41 52.77,44.9 ; 93.73,7.76 93.39,7.76 93.1,8.05 C7.1 ; 93.73,7.76 93.73,6.6 93.71,6.57 93.71,6.53 93.27,6.09 v2(91.18,6.09) ; 67.68,43.8 R1.1 67.68,48.47 70.11,50.91 73.65,50.91 77.21,54.46 J2.1 ; U2.18 90.05,11.12 90.05,9.67 89.37,8.98 ; v2(60.34,43.43) 61.07,42.7 ; 83.35,7.82 U2.4 ; 83.35,7.82 83.35,8.74 82.05,10.04 v2(82.05,10.05) ; 11.32,48.76 v1(26.6,48.76) 32.43,48.76 v1(37.1,44.09) 37.69,43.49 37.69,43.01 37.7,42.86 37.7,37.7 38.14,37.26 41.85,37.26 ; 89.37,8.98 v2(89.41,8.94)
  Bottom Layer w0.3: 138.65,47.78 139.56,48.69 v1(139.7,48.69) ; 27.85,50.6 26.6,49.35 v1(26.6,48.76) ; 132.32,42.67 132.32,41.68 v1(132.29,41.65) ; v1(37.1,44.09) 37.1,44.23 36.38,44.95
  Bottom Layer w0.5: J5.2 122.21,19.56 v2(121.4,20.37) ; S2.3 164.71,50.79 162.92,50.79 R7.1 161.23,50.68 v2(161,50.68) ; v2(76.94,13.28) 79.3,10.92 79.3,10.42 79.67,10.05 v2(82.05,10.05) ; R4.1 10.67,48.11 v2(11.32,48.76) 11.32,50.87 11.02,51.17 5.16,51.17 3.9,49.9 S1.3 ; J3.1 v2(91.18,6.09) 89.66,7.61 89.66,8.7 v2(89.41,8.94) ; v2(57.79,43.43) v2(60.34,43.43) ; v2(116.51,36.87) J4.5
GND: length 64.8
  Top Layer w0.25: 63.15,45.96 64.18,45.96 v1(64.2,45.98) ; v2(121.97,1.44) SW1.1 ; SW3.2 125.35,44.18 v1(124.25,43.08) ; 107.48,23.42 U4.16 106.83,23.61 v1(106.09,24.35) ; U3.16 U3.15 65.88,18.92 U3.17 U3.17 U3.17 62.63,22.17 U3.7 ; v1(62.38,39.32) 64.22,39.32 C5.1
  Top Layer w0.3: 110.73,18.45 110.73,19.52 ; 167.25,47.85 167.16,47.76 v1(167.16,47.2) ; v1(106.48,39.61) 106.48,40.06 R17.2 ; v2(103.25,10.83) 104.03,10.83 v2(105.3,12.1) ; 106.15,10.7 104.55,10.7 ; 107.7,46.82 v1(108.4,46.82) ; 58.55,13.85 v1(58.55,13.15) ; R15.2 107.7,14.21 v2(107.7,13.4) ; v2(95.55,13.7) 96,13.7 96.1,13.8
  Top Layer w0.4: U3.7 62.63,26.13 R14.2
  Bottom Layer w0.25: R24.2 39.93,34.95 v1(41.37,33.51) 42.5,34.64 C19.1 ; J5.6 122.62,24.96 v2(123.55,25.89) ; R26.2 132.36,38 v1(131.11,36.76) 131.11,36.82 C20.1
  Bottom Layer w0.3: 98.3,12.2 98.3,11.4 v2(98.8,10.9) ; 107.5,13.2 106.3,13.2 ; 106.5,19.5 106.4,19.4 106.4,16.7 106.2,16.5 106.2,13.2 106.1,13.1 106.1,13 105.3,12.2 v2(105.3,12.1) ; v2(99.55,9.22) 100.4,10.07 100.4,10.2 100.8,10.6 100.9,10.6 101.13,10.83 v2(103.25,10.83) ; 137.38,49.05 137.62,49.05 v1(139.07,50.5) ; v1(38.69,45.15) 37.65,46.19 37.65,46.22
  vias: v1(8.31,50.32) v1(81.29,7.06) v2(87.56,3.67) v2(88.13,12.81) v2(94.1,11.25) v2(98.16,12.43) v2(100.8,10.8) v2(104.3,10.8) v2(106.6,19.7) v2(108.15,11.46) v2(110.86,14.46) v2(114.67,27.41)
VBAT: length 182.9
  Top Layer w0.4: 110.08,25.3 110,25.3
  Top Layer w0.5: U4.11 110.08,25.3 ; 63.08,15.9 63.28,16.1 U3.11 ; C11.1 63.28,14.72
  Top Layer w1: v1(99.46,12.7) v1(100.46,12.7) R2.1 ; 63.08,14.25 63.08,15.9
  Top Layer w1.1: 110.08,25.3 110.08,26.75
  Top Layer w1.5: U1.1 57.99,46.25 59.05,45.19 59.05,38.31 60.17,37.19 69.21,37.19 ; 68.95,35.53 69.46,36.05 69.46,41 68.76,41.7 67.56,41.7 ; 68.95,35.53 67.69,34.27 C1.1 ; 68.95,35.53 68.92,35.57
  Top Layer w1.6: C13.1 C11.1 ; C14.1 C16.1 ; C17.1 110.74,33.82
  Top Layer w2: 61.59,13.82 61.59,10.73 J1.1
  Top Layer w2.2: C2.1 107.06,34.02 M3.1 ; M3.1 110.74,27.03 ; M3.1 110.74,33.82
  Bottom Layer w1: D1.1 110.1,26.6 110.1,27.56 110.74,28.2 M3.1
  Bottom Layer w1.5: 105.02,20.81 105.02,13.7 104.51,13.19 ; 104.26,12.93 104.03,12.7 v1(100.46,12.7) v1(99.46,12.7) ; C2.1 108.1,32.59 108.1,24 105.1,21
  Bottom Layer w2.5: J1.1 55.11,12.13 55.11,21.06 65.65,31.6 C1.1 67.3,34.27 78.35,45.32 93.09,45.32 104.39,34.02 C2.1
VBAT_A7: length 20.9
  Top Layer w0.25: v2(95.15,15.24) 95.51,15.6 100.62,15.6 R2.2 R3.1 101.97,9.46 101.91,9.41 C6.1 ; v2(94.56,14.65) 94.24,14.33 92.12,14.33 91.73,13.94 90.32,13.94 89.83,14.43 88.83,14.43 U2.22
  Bottom Layer w0.25: v2(95.15,15.24) v2(94.56,14.65)
AREF: length 9.3
  Top Layer w0.25: U2.20 90.14,13.47 91.27,13.47 91.72,13.02 96.66,13.02 C8.1
B1_D11: length 65.2
  Top Layer w0.25: U2.15 91.48,7.45 91.78,7.45 v2(91.81,7.49) ; v2(102.83,8.91) 107.01,8.91 v2(109.57,11.47) ; SW2.1 118.32,38.2 v2(117.81,37.68)
  Bottom Layer w0.25: v2(117.81,37.68) 117.81,29.45 120.13,27.13 ; 120.13,27.13 121.35,25.91 121.35,23.37 J5.4 ; 120.13,27.13 109.57,16.56 v2(109.57,11.47) ; v2(91.81,7.49) 92.2,7.1 92.2,5.95 94.48,3.66 95.64,3.66 96.01,4.03 96.01,6.35 96.15,6.49 96.54,6.49 97.47,7.42 99.94,7.42 101.44,8.91 v2(102.83,8.91)
B2_D12: length 70.1
  Top Layer w0.25: SW3.1 118.32,43.33 123.58,38.08 124.72,38.08 v2(125.03,37.78) ; v2(101.3,9.91) 100.69,9.91 98.92,11.68 95.7,11.68 v2(95,10.97) ; U2.16 91.93,8.88 v2(92.29,9.24)
  Bottom Layer w0.25: 120.08,17.82 120.08,17.17 112.82,9.91 v2(101.3,9.91) ; 120.08,17.82 J5.1 ; 120.08,17.82 123.12,17.82 125.02,19.72 125.02,37.77 v2(125.03,37.78) ; v2(92.29,9.24) 93.84,9.24 95,10.4 v2(95,10.97)
BT_RXD: length 4.9
  Bottom Layer w0.25: R20.2 R21.1 115.06,43.03 J4.2
BT_TXD: length 5.5
  Top Layer w0.25: v2(113.52,44.72) 113.52,43.04 J4.3
  Bottom Layer w0.25: v2(113.52,44.72) R22.2
C0_A4: length 63.2
  Top Layer w0.25: J2.4 86.5,57.41 94.86,57.41 96.39,55.89 96.39,21.7 v2(89.78,15.09) ; v2(86.26,14.11) 85.67,13.52 84.27,13.52 83.85,13.95
  Bottom Layer w0.25: v2(86.26,14.11) 87.24,15.09 v2(89.78,15.09)
CPH_A: length 4.9
  Top Layer w0.25: C12.1 66.41,14.25 64.58,16.08 64.58,17.68
CPH_B: length 7.4
  Top Layer w0.3: U4.13 108.78,24.54 107.87,25.46 104.31,25.46 104.13,25.63 104.13,26.71 C15.1
CPL_A: length 5.5
  Top Layer w0.25: U3.14 65.23,16.38 66.17,15.44 67.36,15.44 C12.2
CPL_B: length 14.1
  Top Layer w0.25: C15.2 105.61,26.75 105.66,26.8 105.66,27.79 105.15,28.3 103.63,28.3 102.74,27.41 102.74,26.11 106.75,22.11 107.69,22.11 108.13,22.54 U4.14
DIRA_D3: length 24.7
  Top Layer w0.25: v2(80.05,10.94) 81.03,9.96 81.03,8.89 ; U3.2 65.88,24.2 66.49,24.81 66.99,24.81 67.71,24.09 v2(67.71,23.61)
  Bottom Layer w0.25: v2(67.71,23.61) 69.08,23.61 76.69,15.99 76.69,14.62 80.05,11.27 v2(80.05,10.94)
DIRB_D4: length 50.3
  Top Layer w0.25: 90.85,20.78 81.42,20.78 v2(79.99,19.34) ; U2.2 81.12,7.85 v2(79.96,7.85) ; v2(75.02,14.92) 75.02,15.69 76.95,17.63 v2(78.42,17.63) ; 107.48,17.68 107.48,16.48 107.47,16.46 103.31,16.46 102.74,15.89 101.2,15.89 101.02,16.07 96.43,16.07 v2(95.72,16.77)
  Bottom Layer w0.25: v2(75.02,14.92) 75.02,14.29 77.56,11.75 77.56,9.5 79.21,7.85 v2(79.96,7.85) ; v2(78.42,17.63) 79.99,19.2 v2(79.99,19.34) ; 90.85,20.78 94.86,16.77 v2(95.72,16.77)
  vias: v2(90.85,20.82)
DRV_SLEEP: length 50.4
  Top Layer w0.25: v2(96.72,18.96) 96.72,18.96 108.06,18.96 108.13,18.89 U4.3 ; 65.24,25.74 R13.2 ; 65.24,25.74 65.24,23.43 U3.3 ; 65.24,25.74 65.62,25.36 v2(66.09,25.36) ; v2(77.09,22.2) 91.53,22.2 92.87,20.86 92.95,20.86
  Bottom Layer w0.25: 92.95,20.86 94.85,18.96 v2(96.72,18.96) ; v2(66.09,25.36) 73.92,25.36 v2(77.09,22.2)
  vias: v2(92.95,20.82)
DTR: length 23.2
  Top Layer w0.25: C18.1 96.96,9.76 95.27,9.76 v2(94.94,9.43) ; v2(88.98,9.71) 88.3,10.39 83.48,10.39 v2(83.47,10.39)
  Bottom Layer w0.25: v2(83.47,10.39) 83.31,10.22 83.31,6.71 J3.5 ; v2(88.98,9.71) 90.19,9.71 91.79,8.11 92.49,8.11 92.67,7.93 94.31,7.93 94.94,8.56 v2(94.94,9.43)
IPROPI_A: length 3.5
  Top Layer w0.25: U3.6 63.28,26.06 63.36,26.13 R14.1
IPROPI_B: length 3.3
  Top Layer w0.25: R15.1 109.59,15.17 110.08,15.66 110.08,17.68
LEDA_D2: length 101.2
  Top Layer w0.25: U2.32 80.76,11.12 80.31,11.57 75.34,11.57 74.25,10.49 68.28,10.49 63.49,5.69 55.49,5.69 53.64,7.54 53.64,22.64 40.36,35.92 37.33,35.92 36.7,36.56 36.7,42.53 31.84,47.38 v2(13.16,47.38)
  Bottom Layer w0.25: R6.1 v2(13.16,47.38)
LEDB_D7: length 110.9
  Top Layer w0.25: v2(108.83,6.3) 112.47,2.67 112.47,1.68 112.9,1.25 115.11,1.25 117.82,3.96 121.82,3.96 122.88,5.02 122.88,21.19 135.57,33.88 135.57,34.95 ; v2(98.18,6.3) 98.01,6.3 96.62,4.91 89.49,4.91 88.35,6.05 ; 135.63,43.03 140.07,47.48 v2(158.67,47.48)
  Top Layer w0.254: 135.57,34.95 135.57,42.97 135.63,43.03
  Bottom Layer w0.25: v2(158.67,47.48) 158.93,47.74 158.93,48.93 R9.1 ; v2(108.83,6.3) 108.78,6.36 98.24,6.36 v2(98.18,6.3)
LEDC_D13: length 75.9
  Top Layer w0.25: v2(106.66,20.59) 106.66,20.99 v2(102.4,25.25) ; v2(121.34,21.33) 120.55,21.33 112.62,13.41 108.71,13.41 v2(108.63,13.33) ; v2(91.54,9.79) 91.54,10.73 91.17,11.11 ; 105.15,43.29 105.15,42.56 v2(99.26,36.67) ; v2(93.88,8.61) 98.01,8.61 v2(98.13,8.74)
  Bottom Layer w0.25: v2(121.34,21.33) 120.58,22.1 J5.3 ; v2(102.4,25.25) 99.26,28.39 v2(99.26,36.67) ; v2(98.13,8.74) 98.13,9.01 100.71,11.59 104.58,11.59 105.12,11.05 106.35,11.05 v2(108.63,13.33) 108.63,18.61 v2(106.66,20.59) ; v2(91.54,9.79) 91.54,9.06 91.98,8.61 v2(93.88,8.61)
MARK_L2_D8: length 184.4
  Top Layer w0.2: 88.92,6.62 88.68,6.62 88.25,7.05 87.75,7.05 v2(87.55,7.25)
  Top Layer w0.25: v2(124.27,20.44) 124.27,4.75 123.03,3.51 118,3.51 115.29,0.8 112.33,0.8 106.67,6.46 99.23,6.46 96.28,3.51 90.22,3.51 v2(90.06,3.68)
  Bottom Layer w0.25: v2(124.27,20.44) 124.27,40.04 116.52,47.8 104.2,47.8 103.12,46.72 99.44,46.72 98.29,47.86 76.7,47.86 67.3,38.46 62.22,38.46 61.84,38.84 44.06,38.84 43.36,39.54 C19.2 ; R24.1 37.7,39.6 ; v2(90.06,3.68) 90.06,5.93 88.77,7.22 87.58,7.22 v2(87.55,7.25)
  Bottom Layer w0.254: 37.7,39.6 37.59,39.6 36.8,40.39 36.8,42.97 33.19,46.58 33.19,47.42 33.55,47.78
MARK_L_A5: length 97.7
  Top Layer w0.25: 41.27,36.15 54.37,23.05 54.37,18.17 v2(57.08,15.46) ; v2(76.03,14.94) 76.13,14.83 81.27,14.83 82.17,13.93 82.57,13.93 82.67,13.83 ; 9.92,50.23 10.98,51.29 31.36,51.29 41.34,41.31 v2(41.34,38.07)
  Bottom Layer w0.25: v2(41.34,38.07) 41.34,36.22 41.27,36.15 ; 9.87,49.53 9.37,49.03 7.87,49.03 7.37,49.53 ; v2(76.03,14.94) 75.42,15.55 57.17,15.55 v2(57.08,15.46)
  vias: v2(9.92,50.32) v2(41.37,36.15)
MARK_R2_D9: length 90.6
  Top Layer w0.25: v2(96.65,5.83) 94.49,5.83 v2(94.48,5.82) ; v2(92.96,6.84) 90.76,6.84 90.7,6.78 90.24,6.78 90.18,6.84 89.82,6.84 89.48,7.18
  Bottom Layer w0.25: 125.47,30.08 128.14,32.75 128.14,39.1 128.52,39.48 129.72,39.48 C20.2 132.3,39.54 R26.1 132.36,39.6 133.85,39.6 134.36,40.11 134.36,43.49 S4.4 ; v2(94.48,5.82) 93.46,6.84 v2(92.96,6.84) ; 125.47,26.14 125.47,17.63
  Bottom Layer w0.254: 132.29,39.33 132.31,39.35 ; 125.47,17.63 125.47,1.4 124.77,0.7 110.4,0.7 107.4,3.7 97.6,3.7 96.65,4.65 96.65,5.83 ; 125.47,30.08 125.47,26.14
MARK_R_A6: length 118.5
  Top Layer w0.25: 125.95,39.86 118.49,47.32 114.32,47.32 112.23,45.23 112.23,41.36 111.49,40.62 109.15,40.62 101.75,33.23 101.75,25.05 92.47,15.77 92.47,14.98 ; U2.19 90.73,12.93 91.05,12.93 91.69,12.3 92.44,12.3 v2(92.47,12.33) ; v2(161.64,47.15) 161.28,47.15 159.93,48.5 159.93,48.6 162.07,50.74 ; 162.07,50.74 161.45,51.36 ; 162.07,50.74 v2(168.36,50.74)
  Top Layer w0.254: 125.96,39.86 128.84,39.86 128.99,39.87 129.13,39.89 129.27,39.92 129.41,39.97 129.55,40.04 129.67,40.11 129.79,40.2 129.9,40.3 140.52,50.92 140.63,51.02 140.75,51.11 140.87,51.18 141.01,51.25 141.15,51.3 141.29,51.33 141.43,51.35 141.58,51.36 161.45,51.36
  Bottom Layer w0.25: S2.4 168.76,50.74 v2(168.36,50.74) ; v2(161.64,47.15) 162.02,47.53 R8.1 ; v2(92.47,12.33) 92.47,14.98
  vias: v2(92.47,15.09)
OUT_A1: length 18.5
  Top Layer w1.5: M1.2 54.73,34.52 58.31,30.94 58.31,25.36 60.09,23.58 61.48,23.58
OUT_A2: length 23.9
  Top Layer w0.4: U3.10 62.63,16.73 61.97,16.07
  Top Layer w1.3: 61.61,16.02 60.71,16.02
  Top Layer w1.5: 60.71,16.02 55.61,21.12 55.61,28.94 ; M1.1 52.57,31.98 55.62,28.94
OUT_B1: length 22.5
  Top Layer w1.5: M2.2 122.17,32.75 124.2,30.71 124.2,28.63 113.24,17.68 112.01,17.68
OUT_B2: length 19
  Top Layer w0.41: 112.09,24.75 110.99,24.75 110.74,24.49 110.74,23.43
  Top Layer w1.5: M2.1 119.5,35.29 117.72,33.51 117.72,28.43 114.26,24.97 112.13,24.97
OUT_C: length 14.7
  Top Layer w1: Q1.3 113.6,40.11 113.6,30.66 M3.2
  Bottom Layer w1: M3.2 113.28,26.83 D1.2
PWMA_D5: length 32.6
  Top Layer w0.25: v2(86.55,8.11) 86.55,5.59 U2.9 ; v2(68.9,19.04) 77.92,19.04 82.14,14.82 82.56,14.82 v2(82.69,14.69) ; U3.1 66.53,21.88 v2(67.03,21.38)
  Bottom Layer w0.25: v2(67.03,21.38) 67.03,20.92 v2(68.9,19.04) ; v2(82.69,14.69) 86.55,10.82 v2(86.55,8.11)
PWMB_D6: length 36.3
  Top Layer w0.25: U2.10 88.09,5.49 89.27,4.3 90.31,4.3 90.62,3.99 94.89,3.99 95.12,4.22 v2(95.12,4.29) ; v2(100.08,17.91) 95.95,17.91 93.75,15.7 93.75,14.99 ; U4.1 106.57,17.94 v2(103.22,17.94)
  Bottom Layer w0.25: v2(95.12,4.29) 95.12,8.11 95.82,8.81 95.82,11.13 93.75,13.2 93.75,14.99 ; v2(103.22,17.94) 102.97,18.19 102.97,18.67 102.72,18.92 100.47,18.92 100.2,18.65 100.2,18.03 v2(100.08,17.91)
  vias: v2(93.75,15.09)
PWMC_D10: length 47.8
  Top Layer w0.25: U2.14 89.59,8.2 v2(87.88,8.2) ; v2(106.1,42.58) 98.54,35.02 98.54,22.63 91.08,15.17 v2(91.08,15.09) ; v2(106.69,43.17) 106.69,43.8 106.94,44.06 107.44,44.06 107.69,44.31 R16.1
  Bottom Layer w0.25: v2(91.08,15.09) 91.08,14.48 87.5,10.9 87.5,8.59 v2(87.88,8.2) ; v2(106.69,43.17) v2(106.1,42.58)
QRE_D1_A: length 3
  Bottom Layer w0.25: S4.1 134.26,46.22 R25.2
QRE_E1_A: length 6.1
  Bottom Layer w0.254: 29.35,50.6 33.27,50.6 34.82,49.05
RESET: length 76.4
  Top Layer w0.25: SW1.2 114.22,5.01 ; 114.22,5.01 112.25,6.97 96.43,6.97 v2(96.29,7.11) ; 114.22,5.01 114.22,12.62 v2(118.34,16.74) ; R10.2 80.98,14.25 82.42,12.81 82.72,12.81 83.65,11.89 88.18,11.89 v2(89.29,10.78) ; 97.28,10.56 97.86,10.56 98.89,9.54 98.89,8.59 v2(98.93,8.54) ; 97.28,10.56 C18.2 ; 97.28,10.56 96.69,10.56 96.43,10.31 v2(93.87,10.31)
  Bottom Layer w0.25: v2(96.29,7.11) 96.29,7.5 96.89,8.11 98.5,8.11 v2(98.93,8.54) ; J5.5 118.3,22.86 118.3,16.78 v2(118.34,16.74) ; v2(93.87,10.31) 93.4,10.78 v2(89.29,10.78)
RX_D0: length 68
  Top Layer w0.25: v2(112.02,46.67) 111.09,47.59 104.48,47.59 97.03,40.14 v2(97.03,29.5) ; 82.15,12.25 83.37,11.03 v2(84.23,11.03)
  Bottom Layer w0.25: J3.3 86.1,5.89 85.72,6.27 85.72,9.54 v2(84.23,11.03) 84.2,11.03 80.96,14.28 80.96,15.82 82.83,17.69 85.4,17.69 97.03,29.33 v2(97.03,29.5) ; R22.1 v2(112.02,46.67)
S0_A0: length 44.9
  Top Layer w0.25: U2.23 87.78,14.61 95.79,22.62 95.79,41.98 94.99,42.78 J2.8
S1_A1: length 45.1
  Top Layer w0.25: v2(89.68,17.93) 89.68,17.54 87.21,15.07 ; v2(95.13,29.45) 95.13,26.39 v2(91.79,23.05) ; v2(95.13,36.3) 95.13,40.36 92.45,43.03 J2.7
  Bottom Layer w0.25: v2(95.13,36.3) v2(95.13,29.45) ; v2(91.79,23.05) 91.79,22.94 89.68,20.83 v2(89.68,17.93)
S2_A2: length 50.8
  Top Layer w0.25: v2(81.93,22.93) 75.43,29.43 75.43,41.26 J2.6 ; U2.25 84.43,15.63 84.13,15.63 v2(81.93,17.83)
  Bottom Layer w0.25: v2(81.93,22.93) v2(81.93,17.83)
S3_A3: length 51.7
  Top Layer w0.25: U2.26 82.31,16.62 81.67,16.62 73.65,24.64 73.65,42.02 J2.5
TX_D1: length 76.5
  Top Layer w0.25: v2(97.24,23.05) 97.66,23.46 97.66,39.09 v2(103,44.43) ; 78.01,12.3 78.75,12.3 78.77,12.32 79.11,12.32 ; v2(106.42,44.43) 106.55,44.43 106.8,44.68 106.8,45.23 107.27,45.7 108.45,45.7 109.52,44.63 v2(109.52,42.24) ; v2(84.92,9.27) 84.82,9.38 83.55,9.38 82.81,10.12 82.81,10.46 U2.31 80.95,12.32 79.11,12.32 ; v2(91.96,20.82) 91.78,20.82 89.56,18.6 80.64,18.6 ; 79.11,12.32 v2(79.11,13.59)
  Bottom Layer w0.25: v2(80.64,18.6) 79.11,17.08 v2(79.11,13.59) ; v2(84.92,9.27) 84.92,7.25 83.56,5.89 J3.4 ; R20.1 111.27,40.37 109.52,42.12 v2(109.52,42.24) ; v2(91.96,20.82) 94.16,23.03 97.24,23.03 ; v2(106.42,44.43) v2(103,44.43)
VCP_A: length 3.5
  Top Layer w0.25: C11.2 64.21,15.04 63.93,15.33 U3.12
VCP_B: length 3.9
  Top Layer w0.25: 107.96,26.75 107.96,26.12 109.43,24.66 U4.12
VREF: length 61.1
  Top Layer w0.25: v2(64.59,25.4) 63.93,24.74 U3.5 ; 106.96,14.24 v2(102.91,14.24) ; 106.96,14.24 106.96,15.45 107.5,16 108.7,16 109.43,16.73 U4.5 ; 106.96,14.24 106.96,12.16 ; R12.1 106.96,12.16 ; 106.96,12.16 R11.2 ; v2(82.03,15.98) 81.65,15.98 76.57,21.06 v2(68.93,21.06)
  Bottom Layer w0.25: v2(64.59,25.4) 64.71,25.4 68.93,21.18 v2(68.93,21.06) ; v2(82.03,15.98) 82.14,16.09 101.06,16.09 v2(102.91,14.24)
XTAL1: length 18.4
  Top Layer w0.25: U2.7 85.39,6.46 85.72,6.46 86.04,6.14 86.04,4.11 85.72,3.79 77.45,3.79 X1.1 75.79,8.54 C9.1
XTAL2: length 9.3
  Top Layer w0.25: C10.1 78.73,6.6 X1.2 80.64,5.44 81.66,4.43 84.48,4.43 84.99,4.93
$1N2281: length 2.1
  Bottom Layer w0.25: S1.1 7.92,48.1 7.93,48.11 R4.2
$1N2302: length 6.8
  Bottom Layer w0.25: S2.1 168.63,49.07 164.41,49.07 163.59,49.89 R7.2
$1N2303: length 5.5
  Top Layer w0.25: R1.2 65.42,45.95 64.37,47.01 62.61,47.01 LED1.2
$1N2306: length 9.4
  Top Layer w0.25: v2(12.27,50.6) 12.05,50.6 10.72,49.28 7.57,49.28 7.05,49.8 LED2.2
  Bottom Layer w0.25: v2(12.27,50.6) 12.38,50.49 12.38,49.69 R6.2
$1N2315: length 8.4
  Top Layer w0.25: LED3.2 162.09,49.8 v2(160.82,48.54)
  Bottom Layer w0.25: R9.2 160.6,48.32 v2(160.82,48.54)
$1N2362: length 2.3
  Top Layer w0.25: LED4.2 105.75,46.14 105.15,45.54 105.15,44.8
$1N2363: length 3.5
  Top Layer w0.25: 76.41,12.3 75.67,12.3 75.66,12.3 R19.2
$1N2452: length 6.2
  Top Layer w0.25: R17.1 107.43,41.39 107.6,41.57 107.69,41.57 ; 107.69,41.57 R16.2 ; 107.69,41.57 Q1.1

## Copper pours and planes (outline as drawn; the poured copper is in the pictures)
GND on Top Layer: -5.21,60.43 173.86,60.43 173.86,-1.8 -5.21,-1.8
GND on Bottom Layer: -8.13,61.96 178.05,61.96 178.05,-5.35 -8.13,-5.35
